# Altium schematic sheet 05_Interface.SchDoc
size A4; SheetNumber: 6; SheetTotal: 6
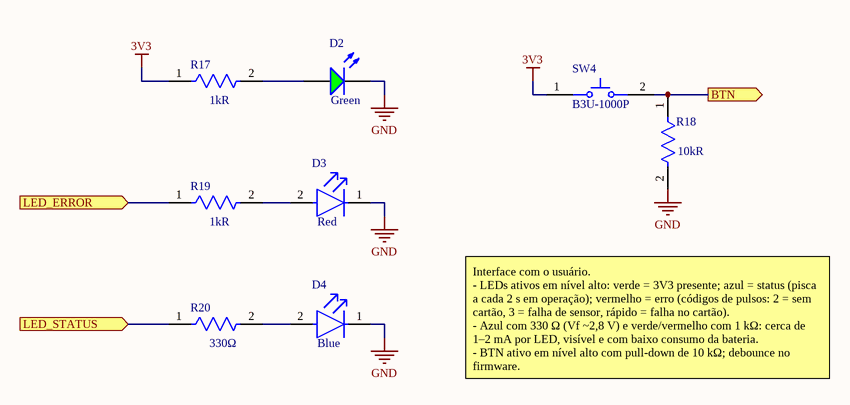
[diagram p0: 05_Interface.SchDoc]

## Parts
D2  Color: Green  [KING-APT1608SGC_V]  (hidden comment: APT1608SGC)
D3  Color: Red  [FP-APT1608EC-MFG]  (hidden comment: APT1608EC)
D4  Color: Blue  [FP-APT1608QBC-D-MFG]  (hidden comment: APT1608QBC/D)
R17  Resistance: 1kR  [FP-RC0603-0_55-IPC_C]  (hidden comment: RC0603FR-071KL)
R18  Resistance: 10kR  [FP-RC0603-0_55-IPC_C]  (hidden comment: RC0603FR-0710KL)
R19  Resistance: 1kR  [FP-RC0603-0_55-IPC_C]  (hidden comment: RC0603FR-071KL)
R20  value 330Ω  [FP-RT0603-MFG]  (hidden comment: RT0603FRE07330RL)
SW4  B3U-1000P  [OMRON-B3U-1000_V]

## Ports
BTN (out, see 00_Top[3C], 02_MCU[3B]), LED_ERROR (in, see 00_Top[3C], 02_MCU[2C]), LED_STATUS (in, see 00_Top[3B], 02_MCU[3A])

## Nets
3V3: R17.1 SW4.1
GND: D2.2(K) D3.1(C) D4.1(C) R18.2
BTN: R18.1 SW4.2 ; port BTN
LED_ERROR: R19.1 ; port LED_ERROR
LED_STATUS: R20.1 ; port LED_STATUS
NetD2_1: D2.1(A) R17.2
NetD3_2: D3.2(A) R19.2
NetD4_2: D4.2(A) R20.2

## Notes on the sheet
- Interface com o usuário.
  - LEDs ativos em nível alto: verde = 3V3 presente; azul = status (pisca a cada 2 s em operação); vermelho = erro (códigos de pulsos: 2 = sem cartão, 3 = falha de sensor, rápido = falha no cartão).
  - Azul com 330 Ω (Vf ~2,8 V) e verde/vermelho com 1 kΩ: cerca de 1–2 mA por LED, visível e com baixo consumo da bateria.
  - BTN ativo em nível alto com pull-down de 10 kΩ; debounce no firmware.

## Library data of the parts
D2 = CMP-2000-05789-1: Super Bright Green LED, 62.5 mW, 25 mA, -40 to 85 degC, 2-Pin SMD, RoHS, Tape and Reel; Manufacturer: Kingbright; Online Catalog: 0603RectanglewithFlatTopChipLEDs; Wavelength - Dominant: 568nm; Wavelength - Peak: 565nm; Voltage - Forward (Vf) (Typ): 2.2V; Lens Type: Clear; Other Names: 754-1121-2; Millicandela Rating: 15mcd; Catalog Drawings: APT1608SeriesTop / APT1608SeriesSide; Lens Style/Size: RectanglewithFlatTop,1.2mmx0.8mm; Current - Test: 20mA; 3D Model: APT1608x.sldprt / APT1608x.pro / APT1608x.igs / APT1608x.stp; Viewing Angle: 120°; Package / Case: 0603(1608Metric); Category: Optoelectronics; Package Description: 2-Pin Surface Mount Device, Body 0.8 x 1.6 mm; Mounting Type: SurfaceMount; Height: 0.75mm; Datasheet Version: Rev. 16B, 02/2012; Family: LEDIndication-Discrete; Manufacturer URL: http://www.kingbright.com/; Package Reference: APT1608SGC; Datasheet URL: https://datasheet.ciiva.com/2113/apt1608sgc-2113808.pdf; Mounting Technology: SurfaceMount; Packaging: Tape&Reel(TR); Standard Package: 2,000; Size / Dimension: 1.60mmLx0.80mmW
D3 = CMP-2000-05179-2: LED RED CLEAR CHIP SMD; Wavelength: 625nm; Forward Voltage: 2V; Forward Current: 20mA; Luminous Intensity: 12mcd; Number of LEDs: 1; Viewing Angle: 120°; Lens Style: Clear; Package Quantity: 2000; Illumination Color: Red; Length: 1.6mm; Case Code (Metric): 1608; Max Operating Temperature: 85°C; Lens Color: Clear; Case/Package: 0603; Test Current: 20mA; Number of Pins: 2; Lead Free: Lead Free; Min Operating Temperature: -40°C; Mount: Surface Mount; Dominant Wavelength: 625nm; Width: 0.8mm; Case Code (Imperial): 0603; Packaging: Tape and Reel; Height: 0.75mm
D4 = CMP-2000-05788-2: LED BLUE CLEAR CHIP SMD; Lens Style: Flat; Forward Current: 20mA; Luminous Intensity: 100mcd; Number of LEDs: 1; Dominant Wavelength: 465nm; Lens Color: Colorless; Forward Voltage: 3.3V; Viewing Angle: 120°; Case Code (Imperial): 0603; Number of Pins: 2; Length: 1.6mm; Mount: Surface Mount; Width: 0.8mm; Height: 0.75mm; Case/Package: 0603; Lead Free: Lead Free; Case Code (Metric): 1608; Lens Transparency: Clear; Min Operating Temperature: -40°C; Packaging: Tape and Reel; Max Operating Temperature: 85°C; Package Quantity: 2000; Test Current: 20mA; Illumination Color: Blue
R17 R19 = CMP-1659-00009-5: RES 1K OHM 1% 1/10W 0603; Voltage Rating: 50V; Power Rating: 100mW; Temperature Coefficient: 100ppm/°C; Military Standard: Not; REACH SVHC: No SVHC; Size Code: 0603; Features: Moisture Resistant; Number of Terminations: 2; Technology: THICK FILM; Series: RC; Case Code (Metric): 1608; Resistance Tolerance: 1%; Resistor Type: Thick Film; Termination: SMD/SMT; Contact Plating: Tin; Radiation Hardening: No; Min Operating Temperature: -55°C; Max Operating Temperature: 155°C; Packaging: Tape and Reel; Max Power Dissipation: 100mW; RoHS Compliant: Yes; Height: 0.45mm; Lead Free: Lead Free; Case/Package: 0603; Length: 1.6mm; Tolerance: 1%; Case Code (Imperial): 0603; Construction: Rectangular; Depth: 0.8mm
R18 = CMP-2100-03664-2: RES 10K OHM 1% 1/10W 0603; Voltage Rating: 75V; Voltage Rating (DC): 50V; Power Rating: 100mW; Temperature Coefficient: 100ppm/°C; Depth: 0.8mm; Termination: SMD/SMT; Resistor Type: Thick Film; Series: RC; Construction: Rectangular; Features: Moisture Resistant; Packaging: Tape and Reel; Min Operating Temperature: -55°C; Number of Terminations: 2; Lead Pitch: 0.3mm; RoHS Compliant: Yes; Case/Package: 0603; Resistance Tolerance: 1%; Military Standard: Not; Weight: 7.1E-05oz; Number of Pins: 2; Tolerance: 1%; Length: 1.6mm; Case Code (Imperial): 0603; Lead Free: Lead Free; Width: 0.8mm; Max Power Dissipation: 100mW; Height: 0.45mm; Max Operating Temperature: 155°C; Case Code (Metric): 1608; Size Code: 0603
R20 = CMP-03412-006947-1: RES SMD 330 OHM 1% 1/10W 0603; Manufacturer: Yageo; Voltage Rating: 75V; Tolerance: 0.01; Temperature Coefficient: 50 ppm/°C; Power Rating: 0.1W; Composition: Thin Film; Automotive: No; ComponentLink2Description: Datasheet; Package: RT0603; Octopart: https://octopart.com/rt0603fre07330rl-yageo-39844739; Ipc Land Pattern Name: RESC16080X45; Footprint Url: http://www.yageo.com/exep/pages/download/literatures/PYu-R_Mount_10.pdf; Lead Free: Yes; Category: Res; Series: RT; Manufacturer Part Number: RT0603FRE07330RL; Digikey Description: RES SMD 330 OHM 1% 1/10W 0603; Mouser Description: Res Thin Film 0603 330 Ohm 1% 0.1W(1/10W) ???}50ppm/???? Molded SMD Paper T/R; ComponentLink2URL: http://www.yageo.com/documents/recent/PYu-RT_1-to-0.01_RoHS_L_9.pdf; Height: 0.55mm; Temperature: -55°C to +155°C; Temperature Range Low: -55°C; Device Class L2: Resistors; Device Class L1: Passive Components; RoHS: TRUE; Device Class L3: Chip SMD Resistors; Resistance: 330Ω; Temperature Range High: +155°C
SW4 = CMP-011-00000-2: Tactile Switch, SPST-NO, 0.05 A, 12 V, -25 to 70 degC, 2-Pin SMD, RoHS, Tape and Reel; Manufacturer: Omron Electronic Components; IP Rating: IP40; Current Rating: 50mA; Max Contact Resistance: 100mohm; Operating Force: 153gf; Throw Configuration: SPST; Resistance: 0.1Ohm; Max Voltage Rating (DC): 12V; Contact Material: Silver; Max Current Rating: 50mA; Datasheet URL: http://www.omron.com/ecb/products/pdf/en-b3u.pdf; Mounting Technology: SM; Case/Package: B3U-1000; Packaging: TapeandReel; Package Reference: B3U-1000; Manufacturer URL: http://www.omron.com/; Datasheet Version: Jan-15; RoHS Compliant: True; Max Operating Temperature: 70°C; Contact Current Rating: 50mA; Package Quantity: 3500; Package Description: 2-Pin Surface Mount Device, Body 3 x 2.5 mm; Voltage Rating (DC): 12V; Min Operating Temperature: -25°C; Voltage Rating: 12V